# Altium schematic sheet Power_Mosfet.SchDoc
size A3; ApprovedBy: Franci lahajnar; DrawnBy: Ciril Močnik; DocumentNumber: 7; SheetNumber: 7; SheetTotal: 12; PageSetup: Record=PageOptions|CenterHorizontal=True|CenterVertical=True|PrintScale=0.96|XCorrection=1.00|YCorrection=1.00|PrintKind=0|BorderSize=5000000|LeftOffset=0|BottomOffset=0|Orientation=2|PaperLength=1000|PaperWidth=1000|Scale=100|PaperSource=7|PrintQuality=600|MediaType=1|DitherType=10|PaperKind=A4 210 x 297 mm|PrintScaleMode=1; Sklop: POWER MOSFET BRIDGE; TipDok: SCHEMATIC
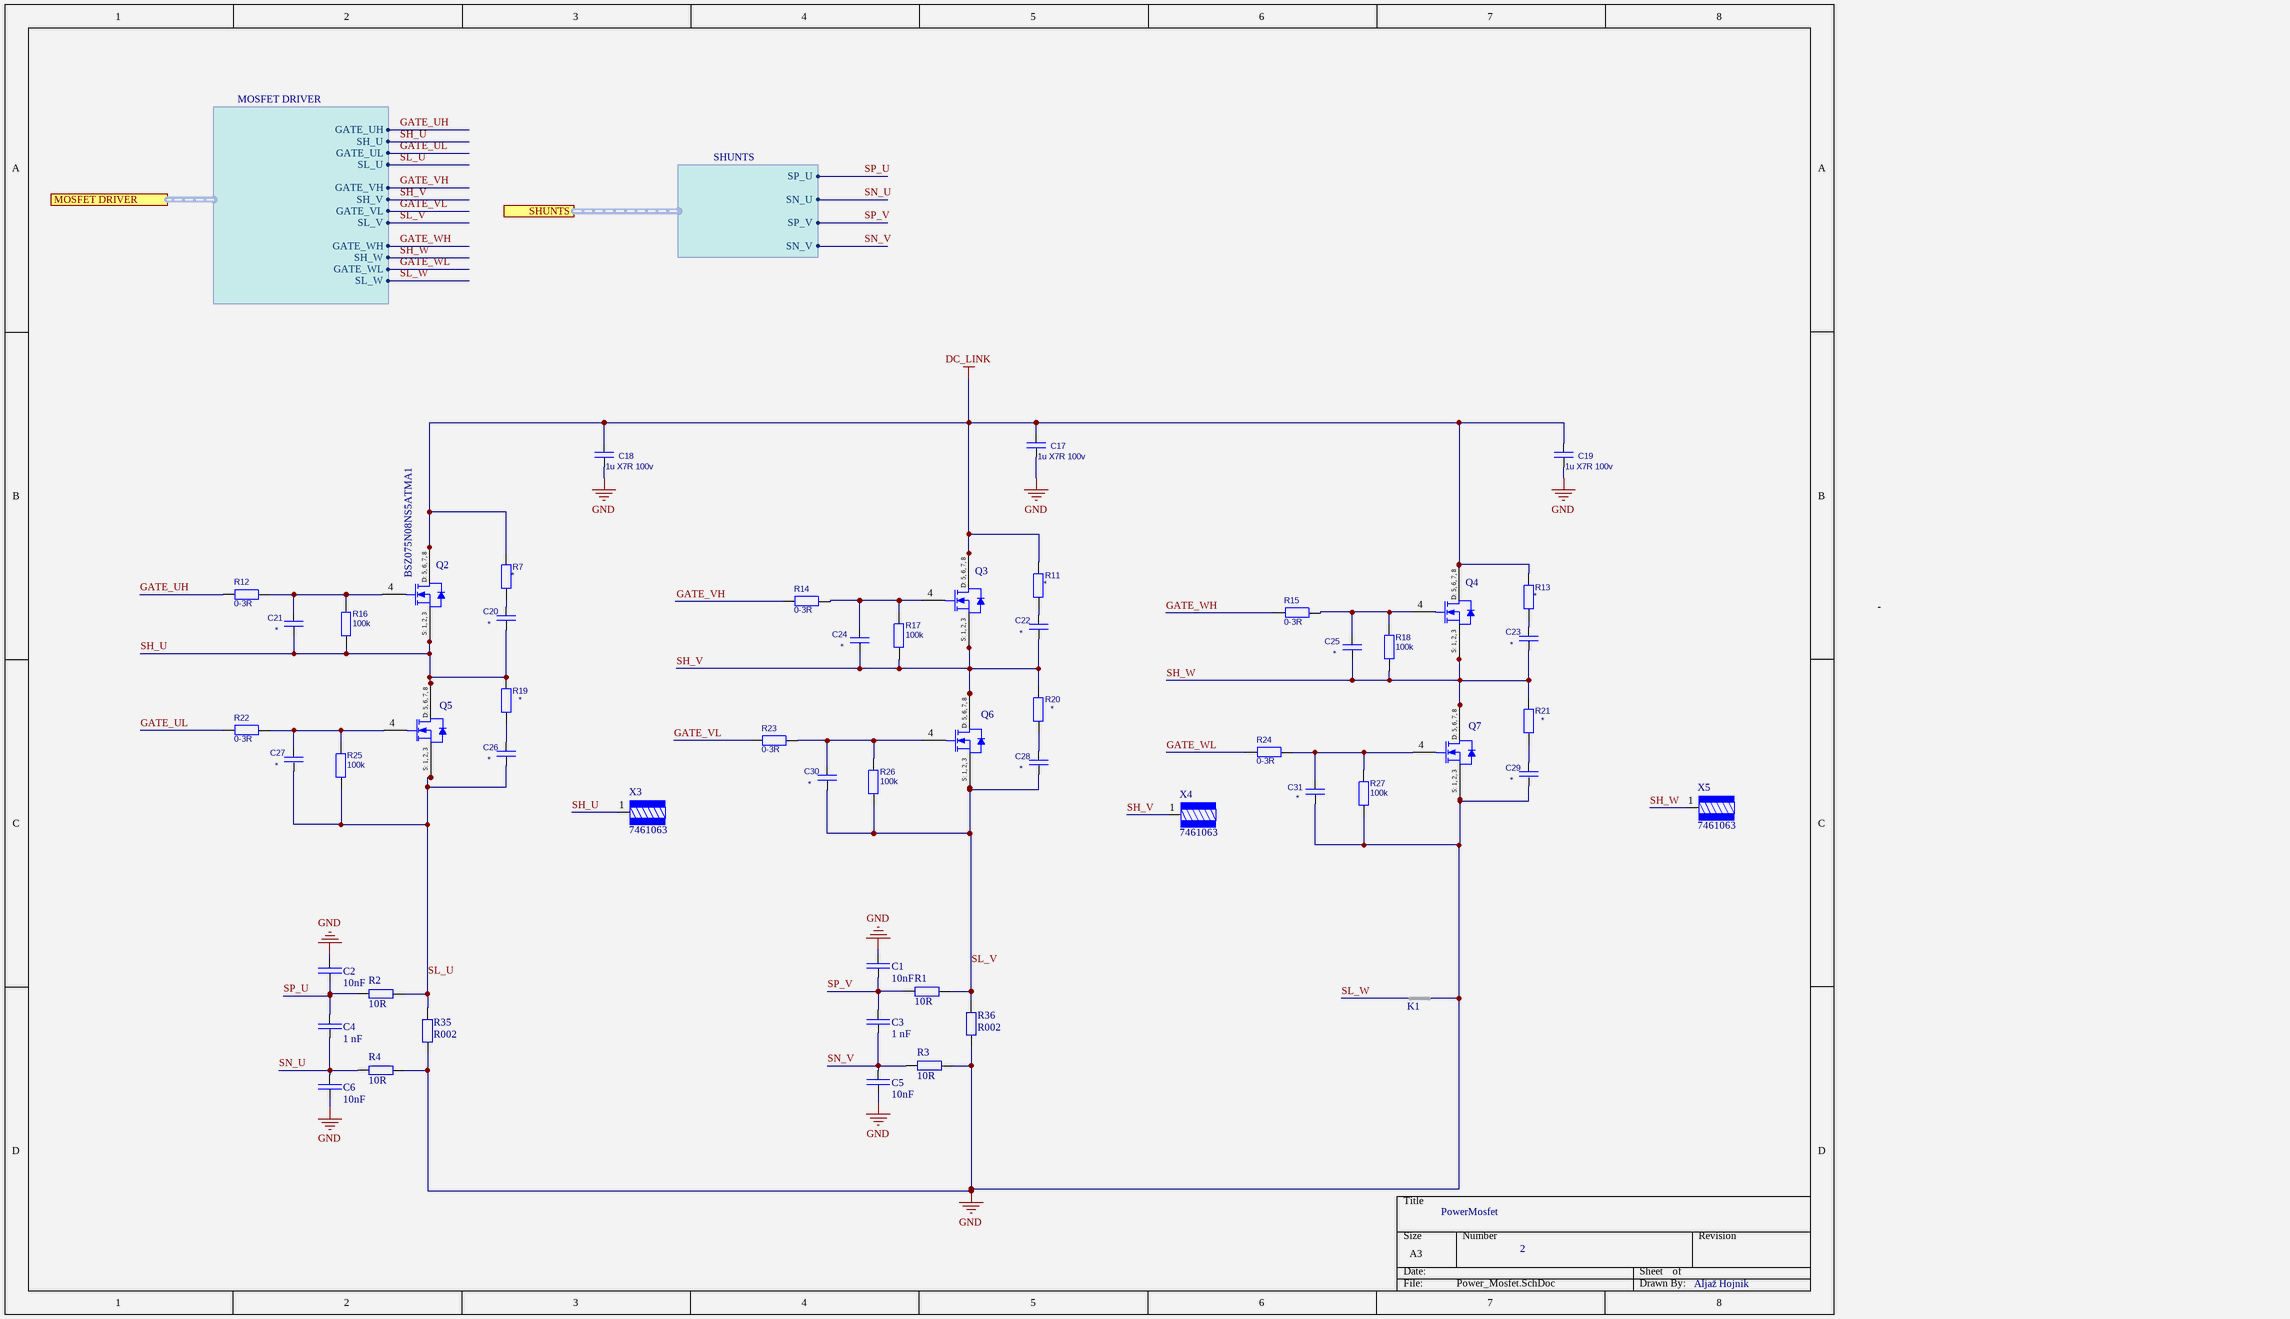
[diagram p0: Power_Mosfet.SchDoc]

## Parts
C1  HRVal: 10nF  [FPR_0603_C_R0]  (hidden comment: C_S_0603_10n_X7R)
C2  HRVal: 10nF  [FPR_0603_C_R0]  (hidden comment: C_S_0603_10n_X7R)
C3  HRVal: 1 nF  [FPR_0603_C_R0]  (hidden comment: C_S_0603_1nF_X7R_3)
C4  HRVal: 1 nF  [FPR_0603_C_R0]  (hidden comment: C_S_0603_1nF_X7R_3)
C5  HRVal: 10nF  [FPR_0603_C_R0]  (hidden comment: C_S_0603_10n_X7R)
C6  HRVal: 10nF  [FPR_0603_C_R0]  (hidden comment: C_S_0603_10n_X7R)
C17  1u X7R 100v  [RCL1210]
C18  1u X7R 100v  [RCL1210]
C19  1u X7R 100v  [RCL1210]
C20  *  [C0603]
C21  *  [C0603]
C22  *  [C0603]
C23  *  [C0603]
C24  *  [C0603]
C25  *  [C0603]
C26  *  [C0603]
C27  *  [C0603]
C28  *  [C0603]
C29  *  [C0603]
C30  *  [C0603]
C31  *  [C0603]
K1  NetTie  [FPR_NETTIE_0_3]  (value not drawn)  (net tie, no BOM)
Q2  BSZ075N08NS5ATMA1  [BSZ075N08NS5ATMA1]
Q3  BSZ075N08NS5ATMA1  [BSZ075N08NS5ATMA1]  (value not drawn)
Q4  BSZ075N08NS5ATMA1  [BSZ075N08NS5ATMA1]  (value not drawn)
Q5  BSZ075N08NS5ATMA1  [BSZ075N08NS5ATMA1]  (value not drawn)
Q6  BSZ075N08NS5ATMA1  [BSZ075N08NS5ATMA1]  (value not drawn)
Q7  BSZ075N08NS5ATMA1  [BSZ075N08NS5ATMA1]  (value not drawn)
R1  HRVal: 10R  [FPR_0603_R_R0]  (hidden comment: R_L_0603_10R_1%)
R2  HRVal: 10R  [FPR_0603_R_R0]  (hidden comment: R_L_0603_10R_1%)
R3  HRVal: 10R  [FPR_0603_R_R0]  (hidden comment: R_L_0603_10R_1%)
R4  HRVal: 10R  [FPR_0603_R_R0]  (hidden comment: R_L_0603_10R_1%)
R7  *  [R0603]
R11  *  [R0603]
R12  0-3R  [R0603]
R13  *  [R0603]
R14  0-3R  [R0603]
R15  0-3R  [R0603]
R16  100k  [R0603]
R17  100k  [R0603]
R18  100k  [R0603]
R19  *  [R0603]
R20  *  [R0603]
R21  *  [R0603]
R22  0-3R  [R0603]
R23  0-3R  [R0603]
R24  0-3R  [R0603]
R25  100k  [R0603]
R26  100k  [R0603]
R27  100k  [R0603]
R35  HRVal: R002  [FPR_2512_R_R1]  (hidden comment: R_L_2512_0R002_1%_4)
R36  HRVal: R002  [FPR_2512_R_R1]  (hidden comment: R_L_2512_0R002_1%_4)
X3  Manufacturer code: 7461063  [FPR_K_1P_WURTH]  (hidden comment: K_WURTH_7461063)
X4  Manufacturer code: 7461063  [FPR_K_1P_WURTH]  (hidden comment: K_WURTH_7461063)
X5  Manufacturer code: 7461063  [FPR_K_1P_WURTH]  (hidden comment: K_WURTH_7461063)

## Ports
MOSFET DRIVER (harness MOSFET DRIVER), SHUNTS (harness Shunts)

## Harnesses
SHUNTS: SP_U, SN_U, SP_V, SN_V
MOSFET DRIVER: GATE_UH, GATE_UL, GATE_VH, GATE_VL, GATE_WH, GATE_WL, SH_U, SL_U, SH_V, SL_V, SH_W, SL_W

## Nets
DC_LINK: C17.1 C18.1 C19.1 Q2.5(D) Q2.6(D) Q2.7(D) Q2.8(D) Q2.9(D) Q3.5(D) Q3.6(D) Q3.7(D) Q3.8(D) Q3.9(D) Q4.5(D) Q4.6(D) Q4.7(D) Q4.8(D) Q4.9(D) R7.1 R11.1 R13.1
GND: C1.2 C2.2 C5.1 C6.1 C17.2 C18.2 C19.2 C29.2 C31.2 K1.1 Q7.1(S) Q7.2(S) Q7.3(S) Q7.10(S) R3.2 R4.2 R27.2 R35.1 R36.1
GATE_UH: R12.1 ; port MOSFET DRIVER.GATE_UH
GATE_UL: R22.1 ; port MOSFET DRIVER.GATE_UL
GATE_VH: R14.1 ; port MOSFET DRIVER.GATE_VH
GATE_VL: R23.1 ; port MOSFET DRIVER.GATE_VL
GATE_WH: R15.1 ; port MOSFET DRIVER.GATE_WH
GATE_WL: R24.1 ; port MOSFET DRIVER.GATE_WL
SH_U: C20.2 C21.2 Q2.1(S) Q2.2(S) Q2.3(S) Q2.10(S) Q5.5(D) Q5.6(D) Q5.7(D) Q5.8(D) Q5.9(D) R16.2 R19.1 X3.1 ; port MOSFET DRIVER.SH_U
SH_V: C22.2 C24.2 Q3.1(S) Q3.2(S) Q3.3(S) Q3.10(S) Q6.5(D) Q6.6(D) Q6.7(D) Q6.8(D) Q6.9(D) R17.2 R20.1 X4.1 ; port MOSFET DRIVER.SH_V
SH_W: C23.2 C25.2 Q4.1(S) Q4.2(S) Q4.3(S) Q4.10(S) Q7.5(D) Q7.6(D) Q7.7(D) Q7.8(D) Q7.9(D) R18.2 R21.1 X5.1 ; port MOSFET DRIVER.SH_W
SL_U: C26.2 C27.2 Q5.1(S) Q5.2(S) Q5.3(S) Q5.10(S) R2.2 R25.2 R35.2 ; port MOSFET DRIVER.SL_U
SL_V: C28.2 C30.2 Q6.1(S) Q6.2(S) Q6.3(S) Q6.10(S) R1.2 R26.2 R36.2 ; port MOSFET DRIVER.SL_V
SL_W: K1.2 ; port MOSFET DRIVER.SL_W
SN_U: C4.1 C6.2 R4.1 ; port SHUNTS.SN_U
SN_V: C3.1 C5.2 R3.1 ; port SHUNTS.SN_V
SP_U: C2.1 C4.2 R2.1 ; port SHUNTS.SP_U
SP_V: C1.1 C3.2 R1.1 ; port SHUNTS.SP_V
NetC20_1: C20.1 R7.2
NetC21_1: C21.1 Q2.4(G) R12.2 R16.1
NetC22_1: C22.1 R11.2
NetC23_1: C23.1 R13.2
NetC24_1: C24.1 Q3.4(G) R14.2 R17.1
NetC25_1: C25.1 Q4.4(G) R15.2 R18.1
NetC26_1: C26.1 R19.2
NetC27_1: C27.1 Q5.4(G) R22.2 R25.1
NetC28_1: C28.1 R20.2
NetC29_1: C29.1 R21.2
NetC30_1: C30.1 Q6.4(G) R23.2 R26.1
NetC31_1: C31.1 Q7.4(G) R24.2 R27.1

## Notes on the sheet
- -
- PowerMosfet
- 2
- Aljaž Hojnik
- Kolektor Group d.o.o.
- KOLEKTOR
- GROUP
- Datum:
- Konst.:
- Naziv
- Sklop
- ECN
- SAP ID
- Rev.:
- List:
- Vojkova 10, p.p. 85
- SI-5280 Idrija , Slovenija
- Koda
- Datoteka:
- (in symbol BSZ075N08NS5ATMA1) D: 5, 6, 7, 8; S: 1, 2, 3

## Library data of the parts
C1 C2 C5 C6 = C_S_0603_10n_X7R-10: Single capacitor 10 nF; Manufacturer code: 06035C103K4Z4A; Manufacturer: AVX; SAP Name: KONDENZATOR 06035C103K4Z4A AVX; Voltage: 50; BS: BS1556; Class: 15562; Tolerance: 10; Value [F]: 10e-9; SAP Ident: 628870; REACH: 12.1.2017; MSL: 1; Mount: SMD; AEC: 16.6.2015; ROHS: 2011/65/EU; TemperatureGrade: -55...125; Datasheet: /; Housing: 0603; UL: -
C3 C4 = C_S_0603_1nF_X7R_3-1: Single capacitor 1nF 5% AEC; Manufacturer code: VJ0603Y102JXAAC; Manufacturer: VISHAY; Tolerance: 5; SAP Name: KONDENZATOR VJ0603Y102JXAAC VIS; Value [F]: 1e-9; Voltage: 50; BS: BS1556; Class: 15562; REACH: 15.1.2019; ROHS: 2011/65/EU; Datasheet: https://eu.mouser.com/datasheet/2/427/vjcommercialseries-222796.pdf; Mount: SMD; AEC: 11.2.2018; Housing: 0603; UL: -; TemperatureGrade: -55...150
C17-C31 = C: Capacitor
  C17-C19: Value: 1u X7R 100v
  C20-C31: Value: *
K1 = NetTie-10: Net tie; ItemName: NetTie; Mount: THT
R1-R4 = R_L_0603_10R_1%-18: Upor 10R 0603 1% 100mW; Manufacturer: ASJ; Manufacturer code: CR16-10R0-FY; Class: 15561; BS: BS1556; Shelf life: 12 months; SAP Name: UPOR CR16-10R0-FY ASJ; SAP Ident: 220173; Tolerance: 1; Power: 100e-3; Value [Ohm]: 10; ROHS: 2011/65/EU; Housing: 0603; Mount: SMD; TemperatureGrade: -40…155; REACH: 14.06.2023; UL: -; MSL: 1; Datasheet: https://www.asj.com.sg/pdfs/specs/1.0%20DS_General%20Thick%20Film%20Chip%20Resistor_19052017.pdf; AEC: 16.7.2015
R7 R11-R27 = R
  R7 R11 R13 R19-R21: Value: *
  R12 R14 R15 R22-R24: Value: 0-3R
  R16-R18 R25-R27: Value: 100k
R35 R36 = R_L_2512_0R002_1%_4-1: Upor 0R002 2512 1% AEC; Manufacturer code: WSLF25122L000FEA; Manufacturer: VISHAY; SAP Name: UPOR WSLF25122L000FEA VIS; Cat1: 2512; Value [Ohm]: 2e-3; Power: 5; Class: 15561; Tolerance: 1; Shelf life: 24mo; SAP Ident: ******; BS: BS1556; AEC: 19.6.2017; FootprintDescription1: SMD resistor 2512 Reflow; FootprintRevisionID1: FPR_2512_R_R1-1; Mount: SMD; UL: -; Latest_Revision: 1; Housing: 2512; REACH: 27.06.2024; TemperatureGrade: -65...170; MSL: 1; Created_At: 19.12.2025 09:12:15 AM; FootprintName1: FPR_2512_R_R1; ROHS: 2011/65/EU; Datasheet: /
X3-X5 = K_WURTH_7461063-4: Connector POWER Wurth 7461063; Manufacturer: WURTH ELEKTRONIK; UL: /; MaxCurrent: 160; AEC: No; Class: 15526; ReleaseDateNum: 45705.4409943981; Voltage: 300; BS: BS1552; SAP Name: KONEKTOR 7461063 WUE; SAP Ident: 1144983; MSL: 1; Mount: THT; TemperatureGrade: -40...150; ItemName: K_WURTH_7461063; Datasheet: /; Current: 160; REACH: 23.07.2024; HRVal: 7461063; PinCount: 1; Terminal pitch: /; Housing: THT; ROHS: 2011/65/EU
Q2-Q7 = BSZ075N08NS5ATMA1: ComponentLink1Description: Mouser; ComponentLink1URL: https://eu.mouser.com/ProductDetail/Infineon-Technologies/BSZ075N08NS5ATMA1?qs=3Bi3m9r5MQbCecwbz%252BCetA%3D%3D; ComponentLink2Description: Octopart; ComponentLink2URL: https://octopart.com/part/infineon/BSZ075N08NS5ATMA1